# Altium project 附属编码器板_slyfocv1.PrjPcb
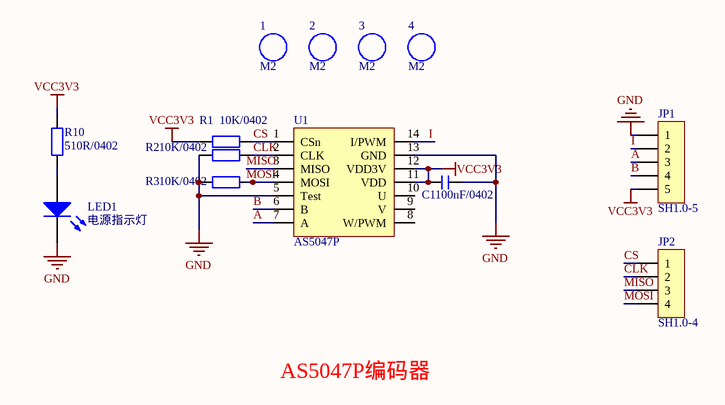
[diagram p0: 原理图.SchDoc]
1 sheet, 13 parts. Net scope: global (net labels, ports and power ports of the same name join across sheets).
Board file: PCB.PcbDoc

## Sheet 原理图.SchDoc
size A4; SheetNumber: 1; SheetTotal: 1

### Parts
1  M2  [M2]
2  M2  [M2]
3  M2  [M2]
4  M2  [M2]
C1  100nF/0402  [0402C]
JP1  SH1.0-5  [SH1.0-5P-P1.00]
JP2  SH1.0-4  [SH1.0-P1.00_-4P]
LED1  电源指示灯  [LED 0603R]
R1  10K/0402  [0402R]
R2  10K/0402  [0402R]
R3  10K/0402  [0402R]
R10  510R/0402  [0402R]
U1  AS5047P  [TSSOP-14]

### Nets
GND: C1.2 JP1.1 LED1.2(K) R2.2 R3.2 U1.5(Test) U1.13(GND)
VCC3V3: C1.1 JP1.5 R1.2 R10.2 U1.11(VDD) U1.12(VDD3V)
A: JP1.3 U1.7(A)
B: JP1.4 U1.6(B)
CLK: JP2.2 R2.1 U1.2(CLK)
CS: JP2.1 R1.1 U1.1(CSn)
I: JP1.2 U1.14(I/PWM)
MISO: JP2.3 U1.3(MISO)
MOSI: JP2.4 R3.1 U1.4(MOSI)
NetLED1_1: LED1.1(A) R10.1

Not connected (* = marked no-connect by the designer): U1 8(W/PWM) 9(V) 10(U)

### Notes on the sheet
- AS5047P编码器

### Library data of the parts
1-4 = M2: 铜柱孔; 版权归属: 源创客; BOM名称: 铜柱孔; 学习资源: www.ooocke.com
C1 = C: 贴片电容; BOM名称: 无极性贴片电容; 版权归属: 源创客; 学习资源: www.ooocke.com
JP1 = 5p_G: 5针排针; BOM名称: 4P接插件; 版权归属: 源创客; 学习资源: www.ooocke.com
JP2 = 4p_G: 4针排针; BOM名称: 4P接插件; 版权归属: 源创客; 学习资源: www.ooocke.com
LED1 = LED: RED 蓝、红; Published: 8-Jun-2000; LatestRevisionDate: 17-Jul-2002; LatestRevisionNote: Re-released for DXP Platform.; PackageDocument: Feb-2002; PackageReference: 3.2X1.6X1.1; Publisher: Altium Limited
R1-R3 R10 = R: 贴片电阻; 版权归属: 源创客; BOM名称: 贴片电阻; 学习资源: www.ooocke.com
U1 = AS5047: 增量式磁编码器